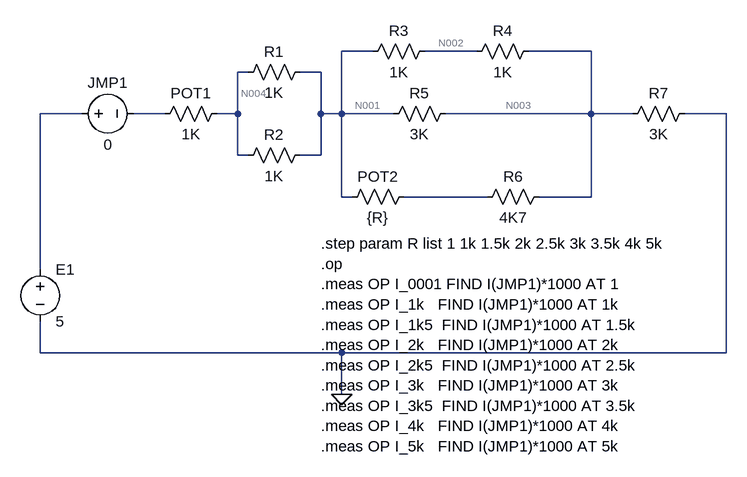
[diagram p0: schematic Draft2.asc]
Draft2.asc, the LTspice schematic file:
Version 4.1
SHEET 1 1028 680
WIRE 480 -64 432 -64
WIRE 640 -64 560 -64
WIRE 816 -64 720 -64
WIRE 288 -32 272 -32
WIRE 400 -32 368 -32
WIRE 32 32 -32 32
WIRE 160 32 112 32
WIRE 272 32 272 -32
WIRE 272 32 240 32
WIRE 400 32 400 -32
WIRE 432 32 432 -64
WIRE 432 32 400 32
WIRE 512 32 432 32
WIRE 816 32 816 -64
WIRE 816 32 592 32
WIRE 880 32 816 32
WIRE 1024 32 960 32
WIRE 272 96 272 32
WIRE 288 96 272 96
WIRE 400 96 400 32
WIRE 400 96 368 96
WIRE 432 160 432 32
WIRE 448 160 432 160
WIRE 656 160 528 160
WIRE 816 160 816 32
WIRE 816 160 736 160
WIRE -32 272 -32 32
WIRE -32 400 -32 352
WIRE 432 400 -32 400
WIRE 1024 400 1024 32
WIRE 1024 400 432 400
WIRE 432 464 432 400
FLAG 432 464 0
SYMBOL voltage 16 32 R270
WINDOW 0 32 56 VTop 2
WINDOW 3 -32 56 VBottom 2
SYMATTR InstName JMP1
SYMATTR Value 0
SYMBOL res 256 16 R90
WINDOW 0 0 56 VBottom 2
WINDOW 3 32 56 VTop 2
SYMATTR InstName POT1
SYMATTR Value 1K
SYMBOL res 384 -48 R90
WINDOW 0 0 56 VBottom 2
WINDOW 3 32 56 VTop 2
SYMATTR InstName R1
SYMATTR Value 1K
SYMBOL res 384 80 R90
WINDOW 0 0 56 VBottom 2
WINDOW 3 32 56 VTop 2
SYMATTR InstName R2
SYMATTR Value 1K
SYMBOL res 576 -80 R90
WINDOW 0 0 56 VBottom 2
WINDOW 3 32 56 VTop 2
SYMATTR InstName R3
SYMATTR Value 1K
SYMBOL res 736 -80 R90
WINDOW 0 0 56 VBottom 2
WINDOW 3 32 56 VTop 2
SYMATTR InstName R4
SYMATTR Value 1K
SYMBOL res 608 16 R90
WINDOW 0 0 56 VBottom 2
WINDOW 3 32 56 VTop 2
SYMATTR InstName R5
SYMATTR Value 3K
SYMBOL res 544 144 R90
WINDOW 0 0 56 VBottom 2
WINDOW 3 32 56 VTop 2
SYMATTR InstName POT2
SYMATTR Value {R}
SYMBOL res 976 16 R90
WINDOW 0 0 56 VBottom 2
WINDOW 3 32 56 VTop 2
SYMATTR InstName R7
SYMATTR Value 3K
SYMBOL res 752 144 R90
WINDOW 0 0 56 VBottom 2
WINDOW 3 32 56 VTop 2
SYMATTR InstName R6
SYMATTR Value 4K7
SYMBOL voltage -32 256 R0
WINDOW 123 0 0 Left 0
WINDOW 39 0 0 Left 0
SYMATTR InstName E1
SYMATTR Value 5
TEXT 400 232 Left 2 !.step param R list 1 1k 1.5k 2k 2.5k 3k 3.5k 4k 5k\n.op\n.meas OP I_0001 FIND I(JMP1)*1000 AT 1\n.meas OP I_1k   FIND I(JMP1)*1000 AT 1k\n.meas OP I_1k5  FIND I(JMP1)*1000 AT 1.5k\n.meas OP I_2k   FIND I(JMP1)*1000 AT 2k\n.meas OP I_2k5  FIND I(JMP1)*1000 AT 2.5k\n.meas OP I_3k   FIND I(JMP1)*1000 AT 3k\n.meas OP I_3k5  FIND I(JMP1)*1000 AT 3.5k\n.meas OP I_4k   FIND I(JMP1)*1000 AT 4k\n.meas OP I_5k   FIND I(JMP1)*1000 AT 5k

The netlist it stands for:
* Draft2.asc
V§JMP1 N005 N006 0
R§POT1 N004 N006 1K
R1 N001 N004 1K
R2 N001 N004 1K
R3 N002 N001 1K
R4 N003 N002 1K
R5 N003 N001 3K
R§POT2 N007 N001 {R}
R7 0 N003 3K
R6 N003 N007 4K7
V§E1 N005 0 5
.step param R list 1 1k 1.5k 2k 2.5k 3k 3.5k 4k 5k
.op
.meas OP I_0001 FIND I(JMP1)*1000 AT 1
.meas OP I_1k   FIND I(JMP1)*1000 AT 1k
.meas OP I_1k5  FIND I(JMP1)*1000 AT 1.5k
.meas OP I_2k   FIND I(JMP1)*1000 AT 2k
.meas OP I_2k5  FIND I(JMP1)*1000 AT 2.5k
.meas OP I_3k   FIND I(JMP1)*1000 AT 3k
.meas OP I_3k5  FIND I(JMP1)*1000 AT 3.5k
.meas OP I_4k   FIND I(JMP1)*1000 AT 4k
.meas OP I_5k   FIND I(JMP1)*1000 AT 5k
.backanno
.end

* Results of the author's LTspice run, read from the files saved beside the schematic
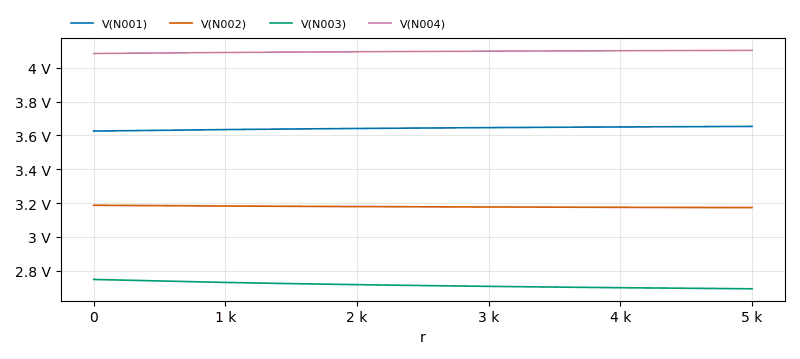
[diagram p1: Operating Point of Draft2.asc, plotted from the saved traces]
* Operating Point, 1 run:
*   V(N001): 3.625 V at r=1 , 3.653 V at r=5 k, min 3.625 V, max 3.653 V
*   V(N002): 3.187 V at r=1 , 3.174 V at r=5 k, min 3.174 V, max 3.187 V
*   V(N003): 2.749 V at r=1 , 2.694 V at r=5 k, min 2.694 V, max 2.749 V
*   V(N004): 4.084 V at r=1 , 4.102 V at r=5 k, min 4.084 V, max 4.102 V
* From the log:
*   i_0001: I(JMP1)*1000 =0.916426710319 at 1
*   i_1k: I(JMP1)*1000 =0.910530507099 at 1000
*   i_1k5: I(JMP1)*1000 =0.908198358957 at 1500
*   i_2k: I(JMP1)*1000 =0.90617116075 at 2000
*   i_2k5: I(JMP1)*1000 =0.904392742086 at 2500
*   i_3k: I(JMP1)*1000 =0.902820029296 at 3000
*   i_3k5: I(JMP1)*1000 =0.901419261936 at 3500
*   i_4k: I(JMP1)*1000 =0.900163664483 at 4000
*   i_5k: I(JMP1)*1000 =0.898006255738 at 5000